# Altium project full_featured_debugger.PrjPcb
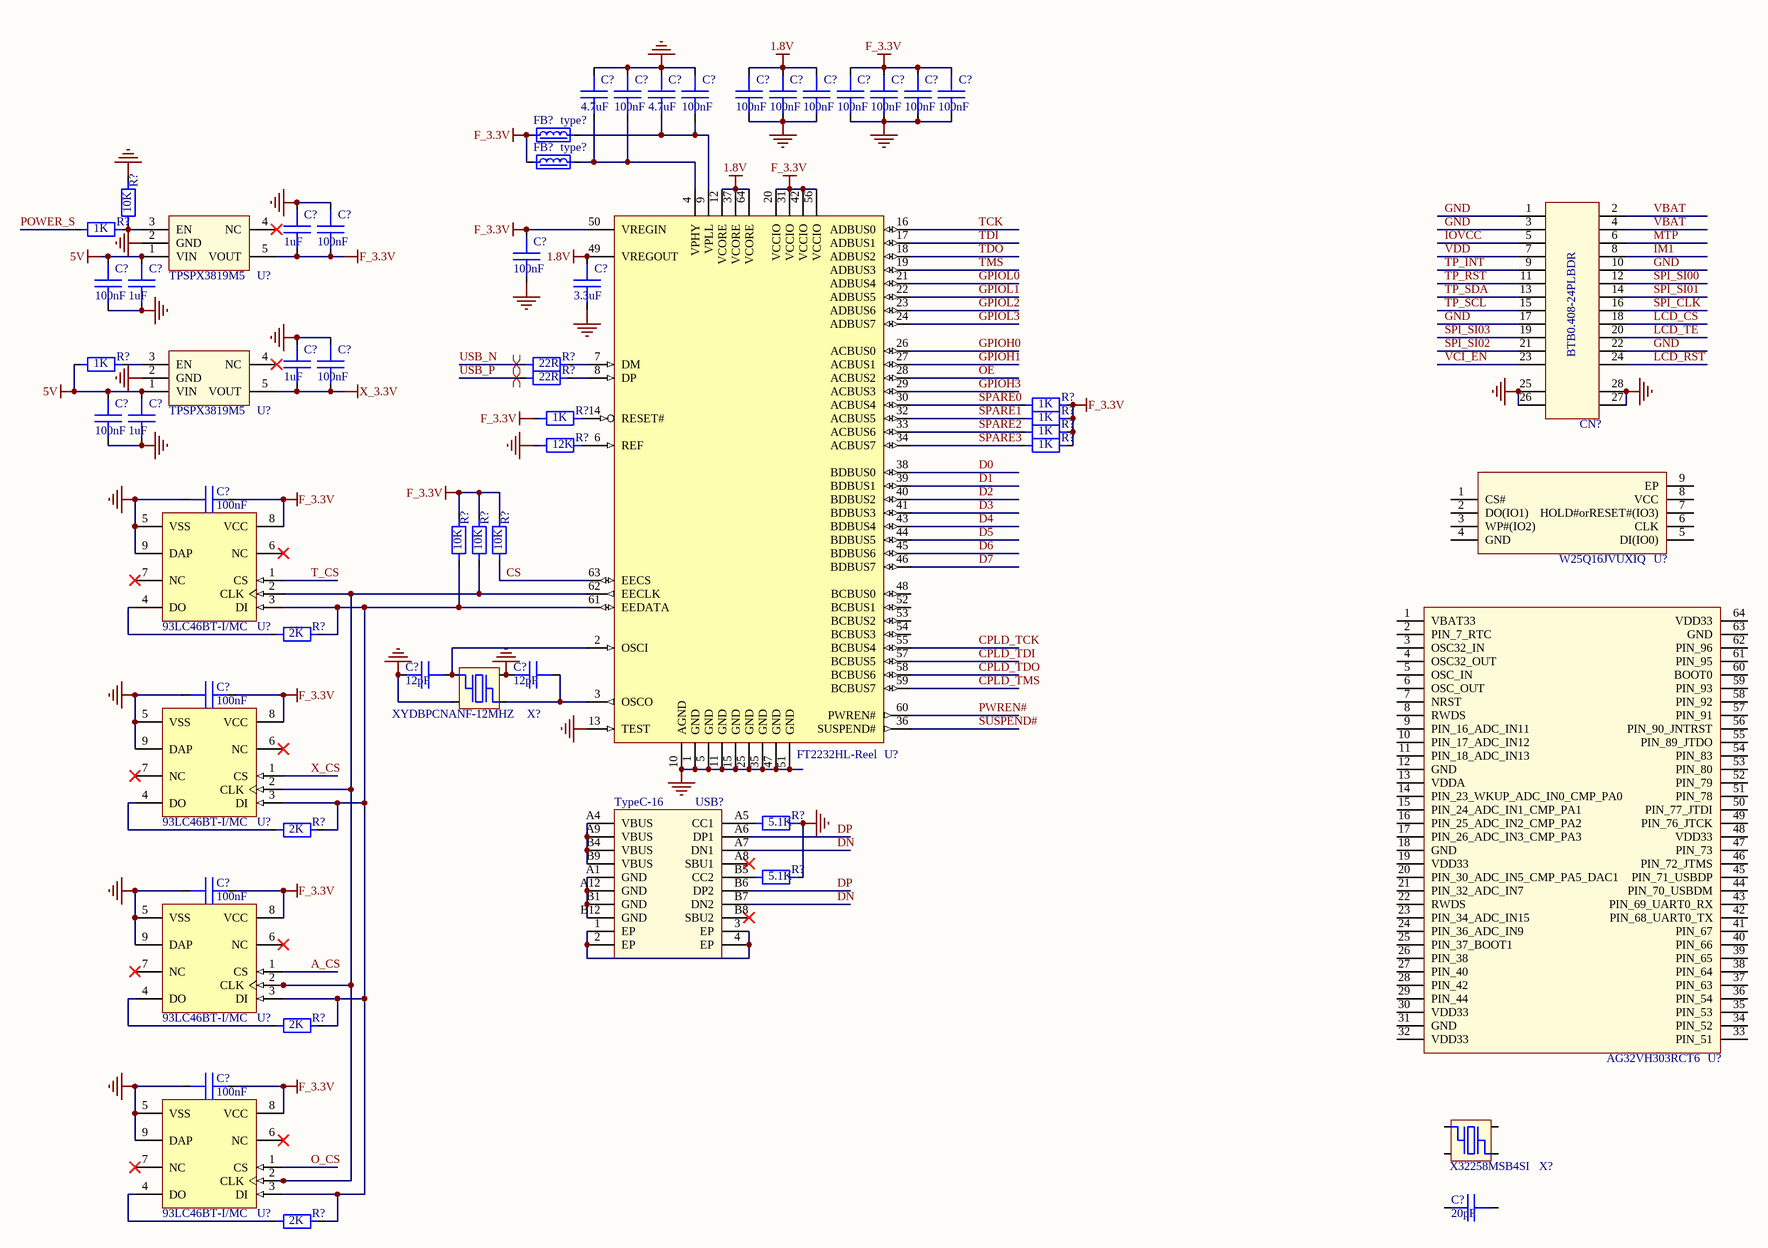
[diagram p0: debugger_top.SchDoc]
5 sheets, 83 parts. Net scope: global (net labels, ports and power ports of the same name join across sheets).
Board file: debugger_pcb.PcbDoc
Sheets:
  debugger_top.SchDoc
  ftdi_series.SchDoc
  jlink_full.SchDoc
  fpga_map.SchDoc
  power_tree.SchDoc

## Sheet debugger_top.SchDoc
size A2; SheetNumber: 1; SheetTotal: 1

### Parts
(Parts that share a designator on the sheet are numbered #1, #2 ... from top to bottom, then left to right.)
C?#1  4.7uF  [C0402]
C?#2  100nF  [C0402]
C?#3  4.7uF  [C0402]
C?#4  100nF  [C0402]
C?#5  100nF  [C0402]
C?#6  100nF  [C0402]
C?#7  100nF  [C0402]
C?#8  100nF  [C0402]
C?#9  100nF  [C0402]
C?#10  100nF  [C0402]
C?#11  100nF  [C0402]
C?#12  1uF  [C0402]
C?#13  100nF  [C0402]
C?#14  100nF  [C0402]
C?#15  100nF  [C0402]
C?#16  1uF  [C0402]
C?#17  3.3uF  [C0402]
C?#18  1uF  [C0402]
C?#19  100nF  [C0402]
C?#20  100nF  [C0402]
C?#21  1uF  [C0402]
C?#22  100nF  [C0402]
C?#23  12pF  [C0402]
C?#24  12pF  [C0402]
C?#25  100nF  [C0402]
C?#26  100nF  [C0402]
C?#27  100nF  [C0402]
C?#28  20pF  [C0402]
CN?  BTB0.408-24PLBDR  [CONN-SMD_BTB0.408-24PLBDR]
FB?#1  type?  [R0402]
FB?#2  type?  [R0402]
R?#1  10K  [R0402]
R?#2  1K  [R0402]
R?#3  1K  [R0402]
R?#4  22R  [R0402]
R?#5  22R  [R0402]
R?#6  1K  [R0402]
R?#7  1K  [R0402]
R?#8  1K  [R0402]
R?#9  1K  [R0402]
R?#10  12K  [R0402]
R?#11  1K  [R0402]
R?#12  10K  [R0402]
R?#13  10K  [R0402]
R?#14  10K  [R0402]
R?#15  2K  [R0402]
R?#16  5.1K  [R0402]
R?#17  2K  [R0402]
R?#18  5.1K  [R0402]
R?#19  2K  [R0402]
R?#20  2K  [R0402]
U?#1  FT2232HL-Reel  [LQFP-64_N]
U?#2  TPSPX3819M5  [SOT-23-5]
U?#3  TPSPX3819M5  [SOT-23-5]
U?#4  W25Q16JVUXIQ  [USON-8_L3.0-W2.0]
U?#5  93LC46BT-I/MC  [DFN-MC8]
U?#6  93LC46BT-I/MC  [DFN-MC8]
U?#7  AG32VH303RCT6  [LQFP-64_L10.0-W10.0]
U?#8  93LC46BT-I/MC  [DFN-MC8]
U?#9  93LC46BT-I/MC  [DFN-MC8]
USB?  TypeC-16  [TYPE-C-16P]
X?#1  XYDBPCNANF-12MHZ  [SMD2520-4P]
X?#2  X32258MSB4SI  [SMD3225-4P]

### Nets
1.8V: C?#5.1 C?#6.1 C?#7.1 C?#17.1 U?#1.12(VCORE) U?#1.37(VCORE) U?#1.49(VREGOUT) U?#1.64(VCORE)
5V: C?#15.1 C?#16.1 C?#20.1 C?#21.1 R?#3.2 U?#2.1(VIN) U?#3.1(VIN)
F_3.3V: C?#8.1 C?#9.1 C?#10.1 C?#11.1 C?#12.2 C?#13.2 C?#14.1 C?#22.1 C?#25.1 C?#26.1 C?#27.1 FB?#1.2 FB?#2.2 R?#6.1 R?#7.2 R?#8.1 R?#9.1 R?#11.1 R?#12.1 R?#13.1 R?#14.1 U?#1.20(VCCIO) U?#1.31(VCCIO) U?#1.42(VCCIO) U?#1.50(VREGIN) U?#1.56(VCCIO) U?#2.5(VOUT) U?#5.8(VCC) U?#6.8(VCC) U?#8.8(VCC) U?#9.8(VCC)
GND: C?#1.1 C?#2.1 C?#3.1 C?#4.1 C?#5.2 C?#6.2 C?#7.2 C?#8.2 C?#9.2 C?#10.2 C?#11.2 C?#12.1 C?#13.1 C?#14.2 C?#15.2 C?#16.2 C?#17.2 C?#18.1 C?#19.1 C?#20.2 C?#21.2 C?#22.2 C?#23.1 C?#24.1 C?#25.2 C?#26.2 C?#27.2 CN?.1 CN?.3 CN?.10 CN?.17 CN?.22 CN?.25 CN?.26 CN?.27 CN?.28 R?#1.1 R?#10.2 R?#16.1 R?#18.1 U?#1.1(GND) U?#1.5(GND) U?#1.10(AGND) U?#1.11(GND) U?#1.13(TEST) U?#1.15(GND) U?#1.25(GND) U?#1.35(GND) U?#1.47(GND) U?#1.51(GND) U?#2.2(GND) U?#3.2(GND) U?#5.5(VSS) U?#5.9(DAP) U?#6.5(VSS) U?#6.9(DAP) U?#8.5(VSS) U?#8.9(DAP) U?#9.5(VSS) U?#9.9(DAP) X?#1.2 X?#1.4
X_3.3V: C?#18.2 C?#19.2 U?#3.5(VOUT)
A_CS: U?#8.1(CS)
CPLD_TCK: U?#1.55(BCBUS4)
CPLD_TDI: U?#1.57(BCBUS5)
CPLD_TDO: U?#1.58(BCBUS6)
CPLD_TMS: U?#1.59(BCBUS7)
CS: R?#14.2 U?#1.63(EECS)
D0: U?#1.38(BDBUS0)
D1: U?#1.39(BDBUS1)
D2: U?#1.40(BDBUS2)
D3: U?#1.41(BDBUS3)
D4: U?#1.43(BDBUS4)
D5: U?#1.44(BDBUS5)
D6: U?#1.45(BDBUS6)
D7: U?#1.46(BDBUS7)
DN: USB?.A7(DN1) USB?.B7(DN2)
DP: USB?.A6(DP1) USB?.B6(DP2)
GPIOH0: U?#1.26(ACBUS0)
GPIOH1: U?#1.27(ACBUS1)
GPIOH3: U?#1.29(ACBUS3)
GPIOL0: U?#1.21(ADBUS4)
GPIOL1: U?#1.22(ADBUS5)
GPIOL2: U?#1.23(ADBUS6)
GPIOL3: U?#1.24(ADBUS7)
IM1: CN?.8
IOVCC: CN?.5
LCD_CS: CN?.18
LCD_RST: CN?.24
LCD_TE: CN?.20
MTP: CN?.6
O_CS: U?#9.1(CS)
OE: U?#1.28(ACBUS2)
POWER_S: R?#2.2
PWREN#: U?#1.60(PWREN#)
SPARE0: R?#6.2 U?#1.30(ACBUS4)
SPARE1: R?#8.2 U?#1.32(ACBUS5)
SPARE2: R?#9.2 U?#1.33(ACBUS6)
SPARE3: R?#11.2 U?#1.34(ACBUS7)
SPI_CLK: CN?.16
SPI_SI00: CN?.12
SPI_SI01: CN?.14
SPI_SI02: CN?.21
SPI_SI03: CN?.19
SUSPEND#: U?#1.36(SUSPEND#)
T_CS: U?#5.1(CS)
TCK: U?#1.16(ADBUS0)
TDI: U?#1.17(ADBUS1)
TDO: U?#1.18(ADBUS2)
TMS: U?#1.19(ADBUS3)
TP_INT: CN?.9
TP_RST: CN?.11
TP_SCL: CN?.15
TP_SDA: CN?.13
USB_N: R?#4.2
USB_P: R?#5.2
VBAT: CN?.2 CN?.4
VCI_EN: CN?.23
VDD: CN?.7
X_CS: U?#6.1(CS)
NetC?#1_2: C?#1.2 C?#2.2 FB?#2.1 U?#1.4(VPHY)
NetC?#3_2: C?#3.2 C?#4.2 FB?#1.1 U?#1.9(VPLL)
NetC?#23_2: C?#23.2 U?#1.2(OSCI) X?#1.1
NetC?#24_2: C?#24.2 U?#1.3(OSCO) X?#1.3
NetR?#1_2: R?#1.2 R?#2.1 U?#2.3(EN)
NetR?#3_1: R?#3.1 U?#3.3(EN)
NetR?#4_1: R?#4.1 U?#1.7(DM)
NetR?#5_1: R?#5.1 U?#1.8(DP)
NetR?#7_1: R?#7.1 U?#1.14(RESET#)
NetR?#10_1: R?#10.1 U?#1.6(REF)
NetR?#12_2: R?#12.2 R?#15.1 R?#17.1 R?#19.1 R?#20.1 U?#1.61(EEDATA) U?#5.3(DI) U?#6.3(DI) U?#8.3(DI) U?#9.3(DI)
NetR?#13_2: R?#13.2 U?#1.62(EECLK) U?#5.2(CLK) U?#6.2(CLK) U?#8.2(CLK) U?#9.2(CLK)
NetR?#15_2: R?#15.2 U?#5.4(DO)
NetR?#16_2: R?#16.2 USB?.A5(CC1)
NetR?#17_2: R?#17.2 U?#6.4(DO)
NetR?#18_2: R?#18.2 USB?.B5(CC2)
NetR?#19_2: R?#19.2 U?#8.4(DO)
NetR?#20_2: R?#20.2 U?#9.4(DO)
NetUSB?_1: USB?.1(EP) USB?.2(EP) USB?.3(EP) USB?.4(EP)
NetUSB?_A1: USB?.A1(GND) USB?.A12(GND) USB?.B1(GND) USB?.B12(GND)
NetUSB?_A4: USB?.A4(VBUS) USB?.A9(VBUS) USB?.B4(VBUS) USB?.B9(VBUS)

Not connected (* = marked no-connect by the designer): C?#28 1 2; U?#1 48(BCBUS0) 52(BCBUS1) 53(BCBUS2) 54(BCBUS3); U?#2 4(NC)*; U?#3 4(NC)*; U?#4 1(CS#) 2(DO(IO1)) 3(WP#(IO2)) 4(GND) 5(DI(IO0)) 6(CLK) 7(HOLD#orRESET#(IO3)) 8(VCC) 9(EP); U?#5 6(NC)* 7(NC)*; U?#6 6(NC)* 7(NC)*; U?#7 1(VBAT33) 2(PIN_7_RTC) 3(OSC32_IN) 4(OSC32_OUT) 5(OSC_IN) 6(OSC_OUT) 7(NRST) 8(RWDS) 9(PIN_16_ADC_IN11) 10(PIN_17_ADC_IN12) 11(PIN_18_ADC_IN13) 12(GND) 13(VDDA) 14(PIN_23_WKUP_ADC_IN0_CMP_PA0) 15(PIN_24_ADC_IN1_CMP_PA1) 16(PIN_25_ADC_IN2_CMP_PA2) 17(PIN_26_ADC_IN3_CMP_PA3) 18(GND) 19(VDD33) 20(PIN_30_ADC_IN5_CMP_PA5_DAC1) 21(PIN_32_ADC_IN7) 22(RWDS) 23(PIN_34_ADC_IN15) 24(PIN_36_ADC_IN9) 25(PIN_37_BOOT1) 26(PIN_38) 27(PIN_40) 28(PIN_42) 29(PIN_44) 30(VDD33) 31(GND) 32(VDD33) 33(PIN_51) 34(PIN_52) 35(PIN_53) 36(PIN_54) 37(PIN_63) 38(PIN_64) 39(PIN_65) 40(PIN_66) 41(PIN_67) 42(PIN_68_UART0_TX) 43(PIN_69_UART0_RX) 44(PIN_70_USBDM) 45(PIN_71_USBDP) 46(PIN_72_JTMS) 47(PIN_73) 48(VDD33) 49(PIN_76_JTCK) 50(PIN_77_JTDI) 51(PIN_78) 52(PIN_79) 53(PIN_80) 54(PIN_83) 55(PIN_89_JTDO) 56(PIN_90_JNTRST) 57(PIN_91) 58(PIN_92) 59(PIN_93) 60(BOOT0) 61(PIN_95) 62(PIN_96) 63(GND) 64(VDD33); U?#8 6(NC)* 7(NC)*; U?#9 6(NC)* 7(NC)*; USB? A8(SBU1)* B8(SBU2)*; X?#2 1 2 3 4

### Layout directives
differential pair: USB_N, USB_P

### Library data of the parts
C?#1-C?#28 = Capacitor: surface mount capacitor.
FB?#1 FB?#2 = Ferrite_Bead
R?#1-R?#20 = Resistance: surface mount resistor.
U?#1 = FT2232HL-Reel: Dual High Speed USB To Multipurpose UART/FIFO IC, LQFP-64, Tape and Reel; Published: 19-Aug-2010; DatasheetVersion: ver 2.08, May-2010; PackageVersion: 2010; PackageReference: LQFP-64; Publisher: Altium Limited; PackageDescription: 64-Pin Thin Quad Flat Pack, 10 x 10 x 1.4 mm Body, 0.5 mm Pitch; ComponentLink1Description: Manufacturer Link; ComponentLink1URL: http://www.ftdichip.com/Products/ICs/FT2232H.htm; ComponentLink2Description: Datasheet; ComponentLink2URL: http://www.ftdichip.com/Support/Documents/DataSheets/ICs/DS_FT2232H.pdf
U?#2 U?#3 = LDO3V3: 3.3V linear voltage regulator.
U?#5 U?#6 U?#8 U?#9 = 93LC46BT-I/MC: 1K, 64x16-bit, 2.5V Microwire Serial EEPROM, 8-Pin DFN, Industrial Temperature, Tape and Reel; Published: 29-Jan-2009; DatasheetVersion: revG, May-2008; PackageVersion: revBB, Aug-2009; PackageReference: DFN-MC8; Publisher: Altium Limited; PackageDescription: 8-Lead Plastic Dual Flat, No Lead Package (MC) - 2x3x0.9mm Body [DFN]; Supplier 1: Digi-Key; Supplier Part Number 1: 93LC46BT-I/MCTR-ND; Supplier 2: Digi-Key; Supplier Part Number 2: 93LC46BT-I/MCCT-ND; Supplier 3: Digi-Key; Supplier Part Number 3: 93LC46BT-I/MCDKR-ND; ComponentLink1Description: Datasheet; ComponentLink1URL: http://ww1.microchip.com/downloads/en/DeviceDoc/21749G.pdf; ComponentLink2Description: Packaging Specification; ComponentLink2URL: http://www.microchip.com/stellent/groups/techpub_sg/documents/packagingspec/en012702.pdf; ComponentLink3Description: Microchip.com Home; ComponentLink3URL: http://www.microchip.com/
X?#1 X?#2 = Oscillator-4: crystal oscillator.

## Sheet ftdi_series.SchDoc
size A4; SheetNumber: 3; SheetTotal: 3

## Sheet jlink_full.SchDoc
size A4; SheetNumber: 3; SheetTotal: 4
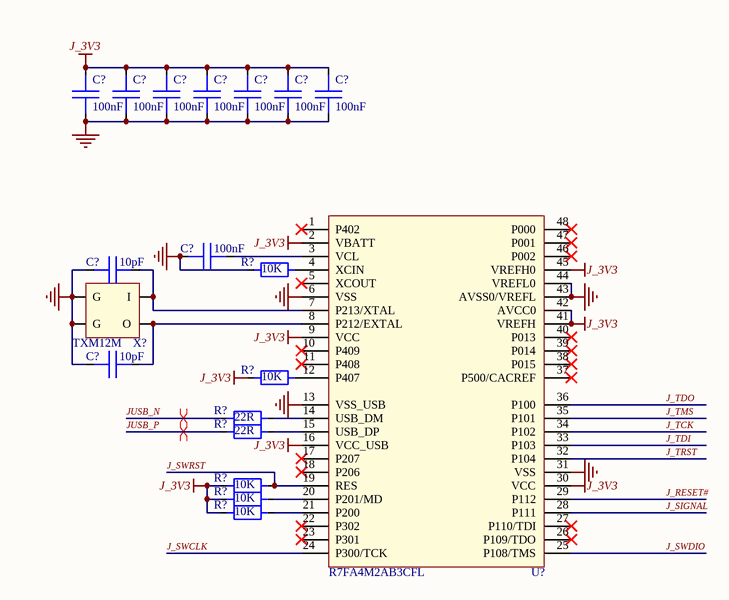
[diagram p1: jlink_full.SchDoc]

### Parts
(Parts that share a designator on the sheet are numbered #1, #2 ... from top to bottom, then left to right.)
C?#29  100nF  [C0402]
C?#30  100nF  [C0402]
C?#31  100nF  [C0402]
C?#32  100nF  [C0402]
C?#33  100nF  [C0402]
C?#34  100nF  [C0402]
C?#35  100nF  [C0402]
C?#36  100nF  [C0402]
C?#37  10pF  [C0402]
C?#38  10pF  [C0402]
R?#21  10K  [R0402]
R?#22  10K  [R0402]
R?#23  22R  [R0402]
R?#24  22R  [R0402]
R?#25  10K  [R0402]
R?#26  10K  [R0402]
R?#27  10K  [R0402]
U?#10  R7FA4M2AB3CFL  [LQFP48]
X?#3  TXM12M  [SMD2520-4P]

### Nets
GND: C?#29.2 C?#30.2 C?#31.2 C?#32.2 C?#33.2 C?#34.2 C?#35.2 C?#36.1 C?#37.1 C?#38.1 R?#21.1 U?#10.6(VSS) U?#10.13(VSS_USB) U?#10.31(VSS) U?#10.43(AVSS0/VREFL) U?#10.44(VREFL0) X?#3.2(G) X?#3.4(G)
J_3V3: C?#29.1 C?#30.1 C?#31.1 C?#32.1 C?#33.1 C?#34.1 C?#35.1 R?#22.1 R?#25.1 R?#26.1 R?#27.1 U?#10.2(VBATT) U?#10.9(VCC) U?#10.16(VCC_USB) U?#10.30(VCC) U?#10.41(VREFH) U?#10.42(AVCC0) U?#10.45(VREFH0)
J_RESET#: U?#10.29(P112)
J_SIGNAL: U?#10.28(P111)
J_SWCLK: U?#10.24(P300/TCK)
J_SWDIO: U?#10.25(P108/TMS)
J_SWRST: R?#25.2 U?#10.19(RES)
J_TCK: U?#10.34(P102)
J_TDI: U?#10.33(P103)
J_TDO: U?#10.36(P100)
J_TMS: U?#10.35(P101)
J_TRST: U?#10.32(P104)
JUSB_N: R?#23.1
JUSB_P: R?#24.1
NetC?#36_2: C?#36.2 U?#10.3(VCL)
NetC?#37_2: C?#37.2 U?#10.7(P213/XTAL) X?#3.1(I)
NetC?#38_2: C?#38.2 U?#10.8(P212/EXTAL) X?#3.3(O)
NetR?#21_2: R?#21.2 U?#10.4(XCIN)
NetR?#22_2: R?#22.2 U?#10.12(P407)
NetR?#23_2: R?#23.2 U?#10.14(USB_DM)
NetR?#24_2: R?#24.2 U?#10.15(USB_DP)
NetR?#26_2: R?#26.2 U?#10.20(P201/MD)
NetR?#27_2: R?#27.2 U?#10.21(P200)

Not connected (* = marked no-connect by the designer): U?#10 1(P402)* 5(XCOUT)* 10(P409)* 11(P408)* 17(P207)* 18(P206)* 22(P302)* 23(P301)* 26(P109/TDO)* 27(P110/TDI)* 37(P500/CACREF)* 38(P015)* 39(P014)* 40(P013)* 46(P002)* 47(P001)* 48(P000)*

### Layout directives
differential pair: JUSB_N, JUSB_P

### Library data of the parts
C?#29-C?#38 = Capacitor
R?#21-R?#27 = Resistance
X?#3 = Oscillator-4: TXM12M0004252DBCEO00T

## Sheet fpga_map.SchDoc
size A4; SheetNumber: 4; SheetTotal: 4
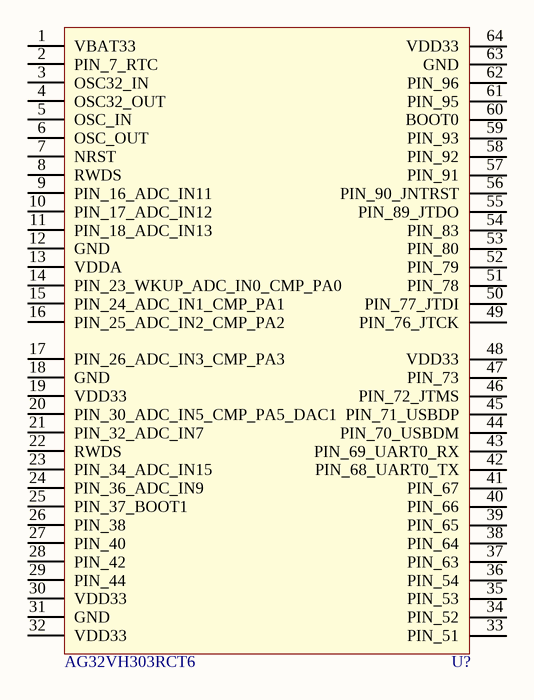
[diagram p2: fpga_map.SchDoc]

### Parts
(Parts that share a designator on the sheet are numbered #1, #2 ... from top to bottom, then left to right.)
U?#11  AG32VH303RCT6  [LQFP64]

### Nets

Not connected (* = marked no-connect by the designer): U?#11 1(VBAT33) 2(PIN_7_RTC) 3(OSC32_IN) 4(OSC32_OUT) 5(OSC_IN) 6(OSC_OUT) 7(NRST) 8(RWDS) 9(PIN_16_ADC_IN11) 10(PIN_17_ADC_IN12) 11(PIN_18_ADC_IN13) 12(GND) 13(VDDA) 14(PIN_23_WKUP_ADC_IN0_CMP_PA0) 15(PIN_24_ADC_IN1_CMP_PA1) 16(PIN_25_ADC_IN2_CMP_PA2) 17(PIN_26_ADC_IN3_CMP_PA3) 18(GND) 19(VDD33) 20(PIN_30_ADC_IN5_CMP_PA5_DAC1) 21(PIN_32_ADC_IN7) 22(RWDS) 23(PIN_34_ADC_IN15) 24(PIN_36_ADC_IN9) 25(PIN_37_BOOT1) 26(PIN_38) 27(PIN_40) 28(PIN_42) 29(PIN_44) 30(VDD33) 31(GND) 32(VDD33) 33(PIN_51) 34(PIN_52) 35(PIN_53) 36(PIN_54) 37(PIN_63) 38(PIN_64) 39(PIN_65) 40(PIN_66) 41(PIN_67) 42(PIN_68_UART0_TX) 43(PIN_69_UART0_RX) 44(PIN_70_USBDM) 45(PIN_71_USBDP) 46(PIN_72_JTMS) 47(PIN_73) 48(VDD33) 49(PIN_76_JTCK) 50(PIN_77_JTDI) 51(PIN_78) 52(PIN_79) 53(PIN_80) 54(PIN_83) 55(PIN_89_JTDO) 56(PIN_90_JNTRST) 57(PIN_91) 58(PIN_92) 59(PIN_93) 60(BOOT0) 61(PIN_95) 62(PIN_96) 63(GND) 64(VDD33)

## Sheet power_tree.SchDoc
size A4; SheetNumber: 4; SheetTotal: 4

## Nets that join several sheets
GND: debugger_top (62 pins), jlink_full (18 pins)